# EasyEDA Pro project cnc_machine.eprj

# Schematic Schematic1
Board Name: Board1; Create Date: 2026-08-07; Page Name: P1; Project Name: cnc_machine; Schematic Name: Schematic1; Update Date: 2026-08-10; Company: EasyEDA.com; Page Size: A4; Version: V1.0
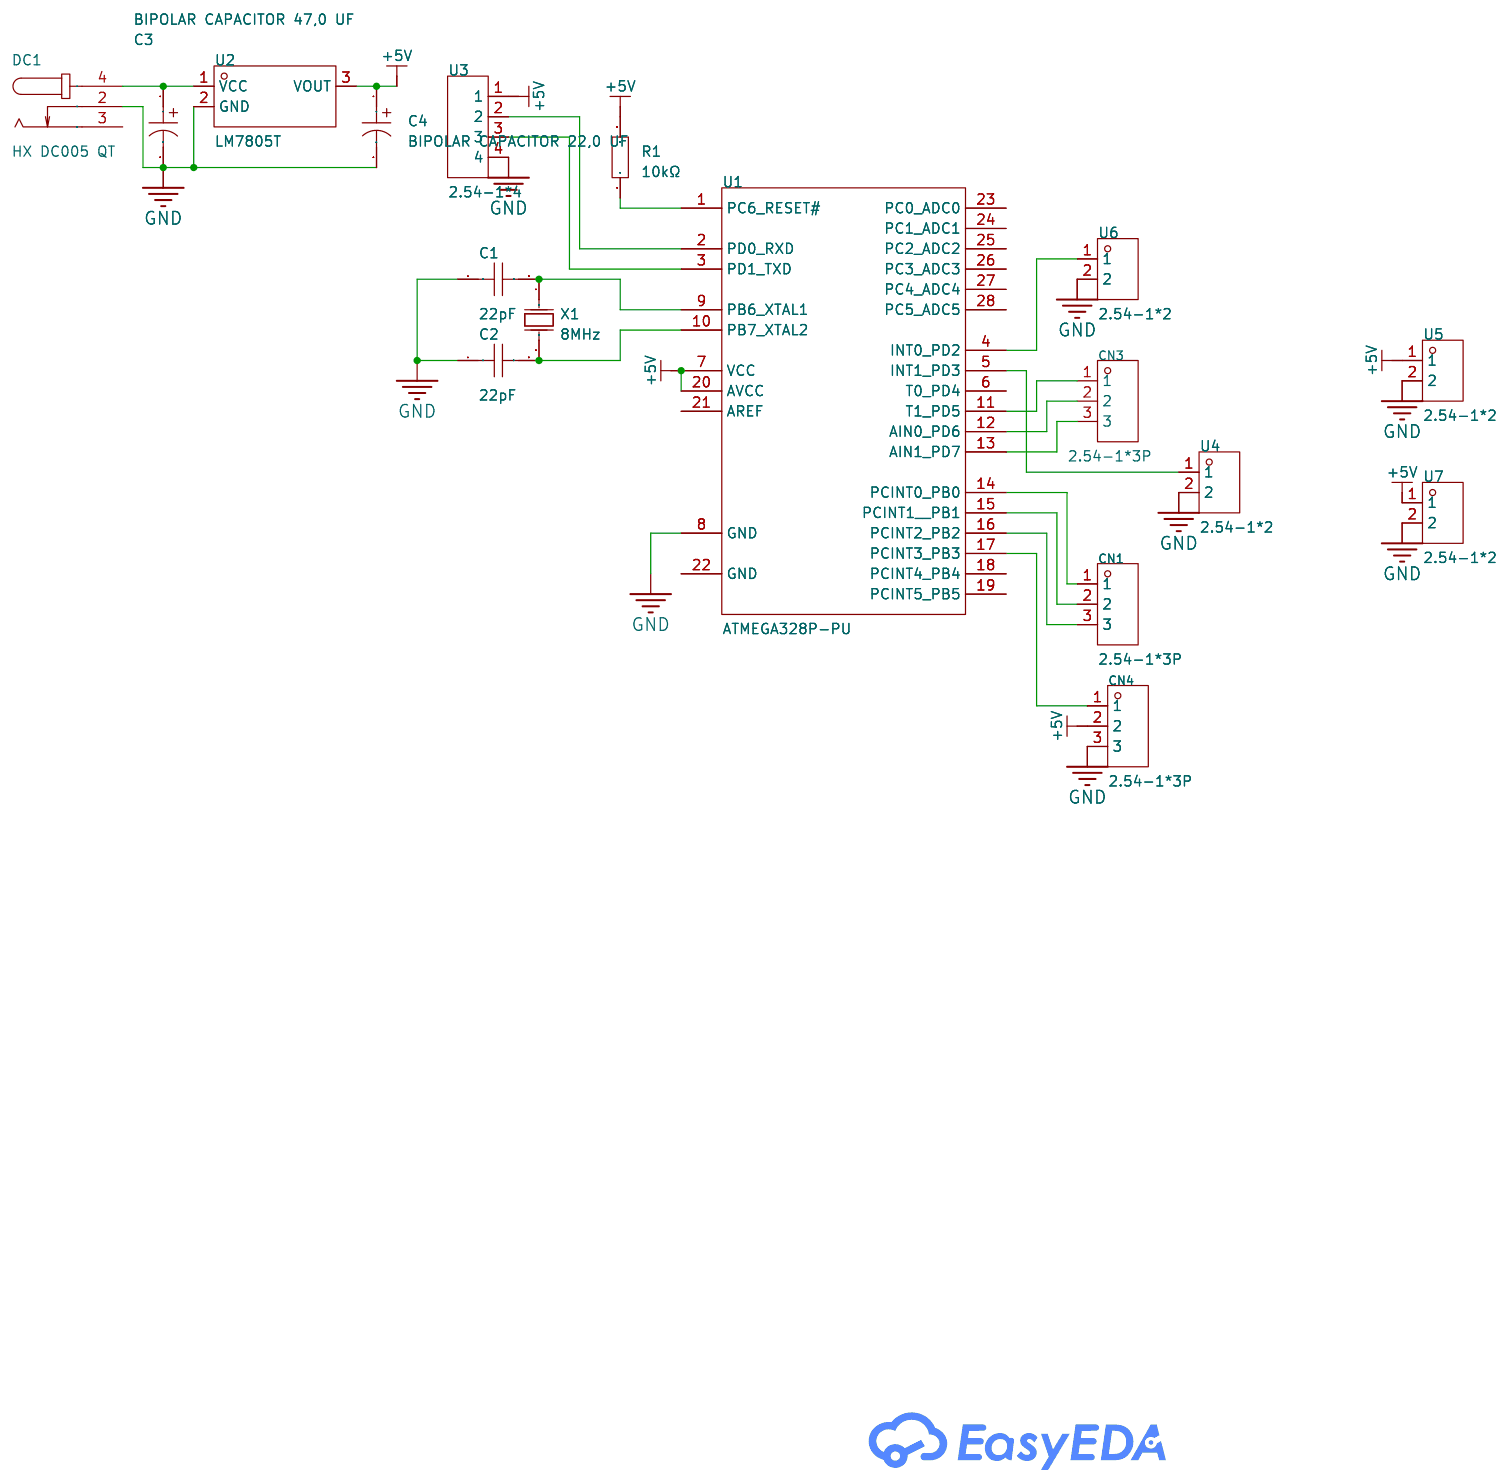
[diagram p0: schematic sheet]

## Parts
C1  22pF  [CAP-TH_L5.8-W2.4-P2.54-D0.6]
C2  22pF  [CAP-TH_L5.8-W2.4-P2.54-D0.6]
C3  BIPOLAR CAPACITOR 47,0 UF  [CAP-TH_BD13.0-P5.00-D0.6-FD]
C4  BIPOLAR CAPACITOR 22,0 UF  [CAP-TH_BD10.0-P5.00-D0.6-FD]
CN1  2.54-1*3P  [CONN-TH_C722693]
CN3  2.54-1*3P  [CONN-TH_C722693]
CN4  2.54-1*3P  [CONN-TH_C722693]
DC1  HX DC005 QT  [DC-IN-TH_HANXIA_HX-DC005-QT]
R1  10kΩ  [RES-TH_BD2.7-L6.2-P10.20-D0.4]
U1  ATMEGA328P-PU  [DIP-28_L34.6-W7.3-P2.54-LS10.2-BL]
U2  LM7805T  [TO-220-3_L10.1-W4.7-P2.54-L]
U3  2.54-1*4  [HDR-TH_4P-P2.54-V-M-1]
U4  2.54-1*2  [HDR-TH_2P-P2.54-V-M]
U5  2.54-1*2  [HDR-TH_2P-P2.54-V-M]
U6  2.54-1*2  [HDR-TH_2P-P2.54-V-M]
U7  2.54-1*2  [HDR-TH_2P-P2.54-V-M]
X1  8MHz  [OSC-TH_L10.0-W4.5-P5.00]

## Library data of the parts
C1 C2 = CC1H220KA1EDCH4B1100: Capacitance:22pF Tolerance:±10% Tolerance:±10% Voltage Rating:50V Pin Spacing:2.54mm Temperature Coefficient:NP0 Diameter:4.8mm Body Thickness:2.4mm; LCSC Part Name: 22pF ±10% 50V; Supplier Part: C2832510; Manufacturer: Dersonic(德尔创); Supplier Footprint: 插件,P=2.54mm; JLCPCB Part Class: Extended Part; Datasheet: https://item.szlcsc.com/datasheet/CC1H220KA1EDCH4B1100/2990648.html; Supplier: LCSC; Tolerance: ±10%; Voltage Rating: 50V; Pin Spacing: 2.54mm; Temperature Coefficient: NP0; Diameter: 4.8mm; Body Thickness: 2.4mm
C3 = BIPOLAR CAPACITOR 47,0 UF: Supplier Part: C6868972; Manufacturer: Visaton; Supplier Footprint: 插件,D13xL26mm; JLCPCB Part Class: Extended Part; Supplier: LCSC
C4 = BIPOLAR CAPACITOR 22,0 UF: Supplier Part: C6131732; Manufacturer: Visaton; Supplier Footprint: 插件,D10xL25.5mm; JLCPCB Part Class: Extended Part; Supplier: LCSC
CN1 CN3 CN4 = 2.54-1*3P: Pins Structure:1x3P Pitch:2.5mm Mounting Type:Through Hole Reference Series:- Number of Pins:3P Number of Rows:1 Number of PINs Per Row:3 Row Spacing:- Current Rating:2A Contact Material:Brass Operating Temperature:-25℃~+85℃ Operating Temperature:-25℃~+85; LCSC Part Name: 1x3P 间距:2.5mm 直插; Supplier Part: C722693; Manufacturer: CAX(创都); Supplier Footprint: 插件,P=2.5mm; JLCPCB Part Class: Extended Part; Datasheet: https://item.szlcsc.com/datasheet/2.54-1*3P/766900.html; Supplier: LCSC; Pins Structure: 1x3P; Pitch: 2.5mm; Mounting Type: Through Hole; Number of Pins: 3P; Number of Rows: 1; Number of PINs Per Row: 3; Current Rating: 2A; Contact Material: Brass; Operating Temperature: -25℃~+85℃; Voltage Rating: 250V; Plastic Material: PA66; Z-Height of the Board: 7mm; X-Length of Bottom Edge on Board (Spacing Line): 7.5mm; Y-Width of Bottom Edge on Board: 5.8mm
DC1 = HX DC005 QT: Connector Type:DC Power Jack Mounting Type:Right Angle Inside Contact Diameter:2mm Outside Contact Diameter:6.3mm Current Rating:2A Voltage Rating (Max):30V Operating Temperature:-25℃~+70℃ Operating Temperature:-25℃~+70℃; LCSC Part Name: DC电源插座 内径:2mm 外径:6.3mm; Supplier Part: C5184829; Manufacturer: hanxia(韩下); Supplier Footprint: 插件; JLCPCB Part Class: Extended Part; Datasheet: https://item.szlcsc.com/datasheet/HX%2520DC005%2520QT/5851208.html; Supplier: LCSC; Connector Type: DC Power Jack; Mounting Type: Right Angle; Inside Contact Diameter: 2mm; Outside Contact Diameter: 6.3mm; Current Rating: 2A; Voltage Rating (Max): 30V; Operating Temperature: -25℃~+70℃
R1 = MF1/4W-10K±1%-ST52: Type:Metal Film Resistor Resistance:10kΩ Tolerance:±1% Tolerance:±1% Voltage-Supply(Max):250V Power(Watts):250mW Temperature Coefficient:±100ppm/℃ Temperature Coefficient:±100ppm/℃ Operating Temperature:-55℃~+155℃ Operating Temperature:-55℃~+155℃; LCSC Part Name: 金属膜电阻 10kΩ ±1% 250mW; Supplier Part: C2903232; Manufacturer: VO(翔胜); Supplier Footprint: 插件,D2.7xL6.2mm; JLCPCB Part Class: Extended Part; Datasheet: https://item.szlcsc.com/datasheet/MF1%252F4W-10K%25C2%25B11%2525-ST52/3158983.html; Supplier: LCSC; Type: Metal Film Resistor; Tolerance: ±1%; Voltage-Supply(Max): 250V; Power(Watts): 250mW; Temperature Coefficient: ±100ppm/℃; Operating Temperature: -55℃~+155℃
U1 = ATMEGA328P-PU: CPU Core:AVR CPU Maximum Speed:20MHz Program Storage Size:32KB Program Memory Type:FLASH Number of I/O:23 ADC (Bit):10bit Voltage - Supply:1.8V~5.5V Voltage - Supply:1.8V~5.5V Applications:-; LCSC Part Name: MSL=1 基于AVR增强型RISC架构的低功耗CMOS 8位微控制器; Supplier Part: C33901; Manufacturer: MICROCHIP(美国微芯); Supplier Footprint: DIP-28-300mil; JLCPCB Part Class: Extended Part; Datasheet: https://item.szlcsc.com/datasheet/ATMEGA328P-PU/34869.html; Supplier: LCSC; CPU Core: AVR; CPU Maximum Speed: 20MHz; Program Storage Size: 32KB; Program Memory Type: FLASH; Number of I/O: 23; ADC (Bit): 10bit; Voltage - Supply: 1.8V~5.5V
U2 = LM7805T_C7432180: Output Configuration:Positive Voltage - Supply:35V Output Voltage:5V Output Voltage:5V Output Current:1.2A Power Supply Rejection Ratio (PSRR):62dB@(120Hz) Voltage Dropout:- standby current:- Noise:40uV Features:Short Circuit Protection；Thermal shutdown O; LCSC Part Name: 5V 1.2A 35V; Supplier Part: C7432180; Manufacturer: HGSEMI(华冠); Supplier Footprint: TO-220-3; JLCPCB Part Class: Extended Part; Datasheet: https://item.szlcsc.com/datasheet/LM7805T/8436622.html; Supplier: LCSC; Output Configuration: Positive; Voltage - Supply: 35V; Output Voltage: 5V; Output Current: 1.2A; Power Supply Rejection Ratio (PSRR): 62dB@(120Hz); Noise: 40uV; Features: Short Circuit Protection；Thermal shutdown; Operating Temperature: 0℃~+125℃@(Ta); Output Type: Fixed; Number of Outputs: 1
U3 = 2.54-1*4: Pin Structure:1x4P Pitch:2.54mm Circluar Pins/Square Pins:Pin Header Mounting Type:Through Hole Number of Rows:1 Number of Pins:4P Current Rating:2.5A Length of Mating Pin:6mm Insulation Height:2.54mm Length of End Connection Pin:3mm Contact Material:Bras; LCSC Part Name: 1x4P 间距:2.54mm 方针 直插; Supplier Part: C5116483; Manufacturer: ZHOURI(洲日); Supplier Footprint: 插件,P=2.54mm; JLCPCB Part Class: Extended Part; Datasheet: https://item.szlcsc.com/datasheet/2.54-1*4/5692726.html; Supplier: LCSC; Pin Structure: 1x4P; Pitch: 2.54mm; Circluar Pins/Square Pins: Pin Header; Mounting Type: Through Hole; Number of Rows: 1; Number of Pins: 4P; Current Rating: 2.5A; Length of Mating Pin: 6mm; Insulation Height: 2.54mm; Length of End Connection Pin: 3mm; Contact Material: Brass; Contact Plating: Gold; Operating Temperature: -40℃~+105℃
U4-U7 = 2.54-1*2: Pin Structure:1x2P Pitch:2.54mm Circluar Pins/Square Pins:Pin Header Mounting Type:Through Hole Number of Rows:1 Number of Pins:2P Current Rating:2.5A Length of Mating Pin:6mm Insulation Height:2.54mm Length of End Connection Pin:3mm Contact Material:Bras; LCSC Part Name: 停产 1x2P 间距:2.54mm 方针 直插; Supplier Part: C5116481; Manufacturer: ZHOURI(洲日); Supplier Footprint: 插件,P=2.54mm; JLCPCB Part Class: Extended Part; Datasheet: https://item.szlcsc.com/datasheet/2.54-1*2/5692724.html; Supplier: LCSC; Pin Structure: 1x2P; Pitch: 2.54mm; Circluar Pins/Square Pins: Pin Header; Mounting Type: Through Hole; Number of Rows: 1; Number of Pins: 2P; Current Rating: 2.5A; Length of Mating Pin: 6mm; Insulation Height: 2.54mm; Length of End Connection Pin: 3mm; Contact Material: Brass; Contact Plating: Gold; Operating Temperature: -40℃~+105℃
X1 = X49SD8MSD2SC: Type:Through Hole Crystal Oscillator Frequency:8MHz Normal temperature Frequency Tolerance:±20ppm Normal temperature Frequency Tolerance:±20ppm Load Capacitance:20pF Frequency Stability:±30ppm Frequency Stability:±30ppm Operating Temperature:-20℃~+70℃ Ope; LCSC Part Name: HC-49US 8MHZ 20PF ±20PPM -20~70℃ (±30PPM); Supplier Part: C21263; Manufacturer: YXC(扬兴晶振); Supplier Footprint: HC-49S; JLCPCB Part Class: Extended Part; Datasheet: https://item.szlcsc.com/datasheet/X49SD8MSD2SC/21980.html; Supplier: LCSC; Type: Through Hole Crystal Oscillator; Normal temperature Frequency Tolerance: ±20ppm; Load Capacitance: 20pF; Frequency Stability: ±30ppm; Operating Temperature: -20℃~+70℃

## Nets
+5V: C4.1 CN4.2 R1.2 U1.7(VCC) U1.20(AVCC) U2.3(VOUT) U3.1 U5.1 U7.1
GND: C1.1 C2.1 C3.2 C4.2 CN4.3 DC1.2 U1.8(GND) U2.2(GND) U3.4 U4.2 U5.2 U6.2 U7.2
$1N785: CN3.1 U1.11(T1 PD5)
$1N787: CN3.2 U1.12(AIN0 PD6)
$1N789: CN3.3 U1.13(AIN1 PD7)
$1N1204: C1.2 U1.9(PB6 XTAL1) X1.1(OSC1)
$1N1213: C2.2 U1.10(PB7 XTAL2) X1.2(OSC2)
$1N1271: R1.1 U1.1(PC6 RESET#)
$1N1369: U1.2(PD0 RXD) U3.2
$1N1378: U1.3(PD1 TXD) U3.3
$1N1468: CN1.1 U1.14(PCINT0 PB0)
$1N1472: CN1.2 U1.15(PCINT1  PB1)
$1N1477: CN1.3 U1.16(PCINT2 PB2)
$1N1538: CN4.1 U1.17(PCINT3 PB3)
$1N1853: U1.4(INT0 PD2) U6.1
$1N1890: U1.5(INT1 PD3) U4.1
$1N2028: C3.1 DC1.4 U2.1(VCC)

Not connected (* = marked no-connect by the designer): DC1 3; U1 6(T0 PD4) 18(PCINT4 PB4) 19(PCINT5 PB5) 21(AREF) 22(GND) 23(PC0 ADC0) 24(PC1 ADC1) 25(PC2 ADC2) 26(PC3 ADC3) 27(PC4 ADC4) 28(PC5 ADC5)

# Board PCB4
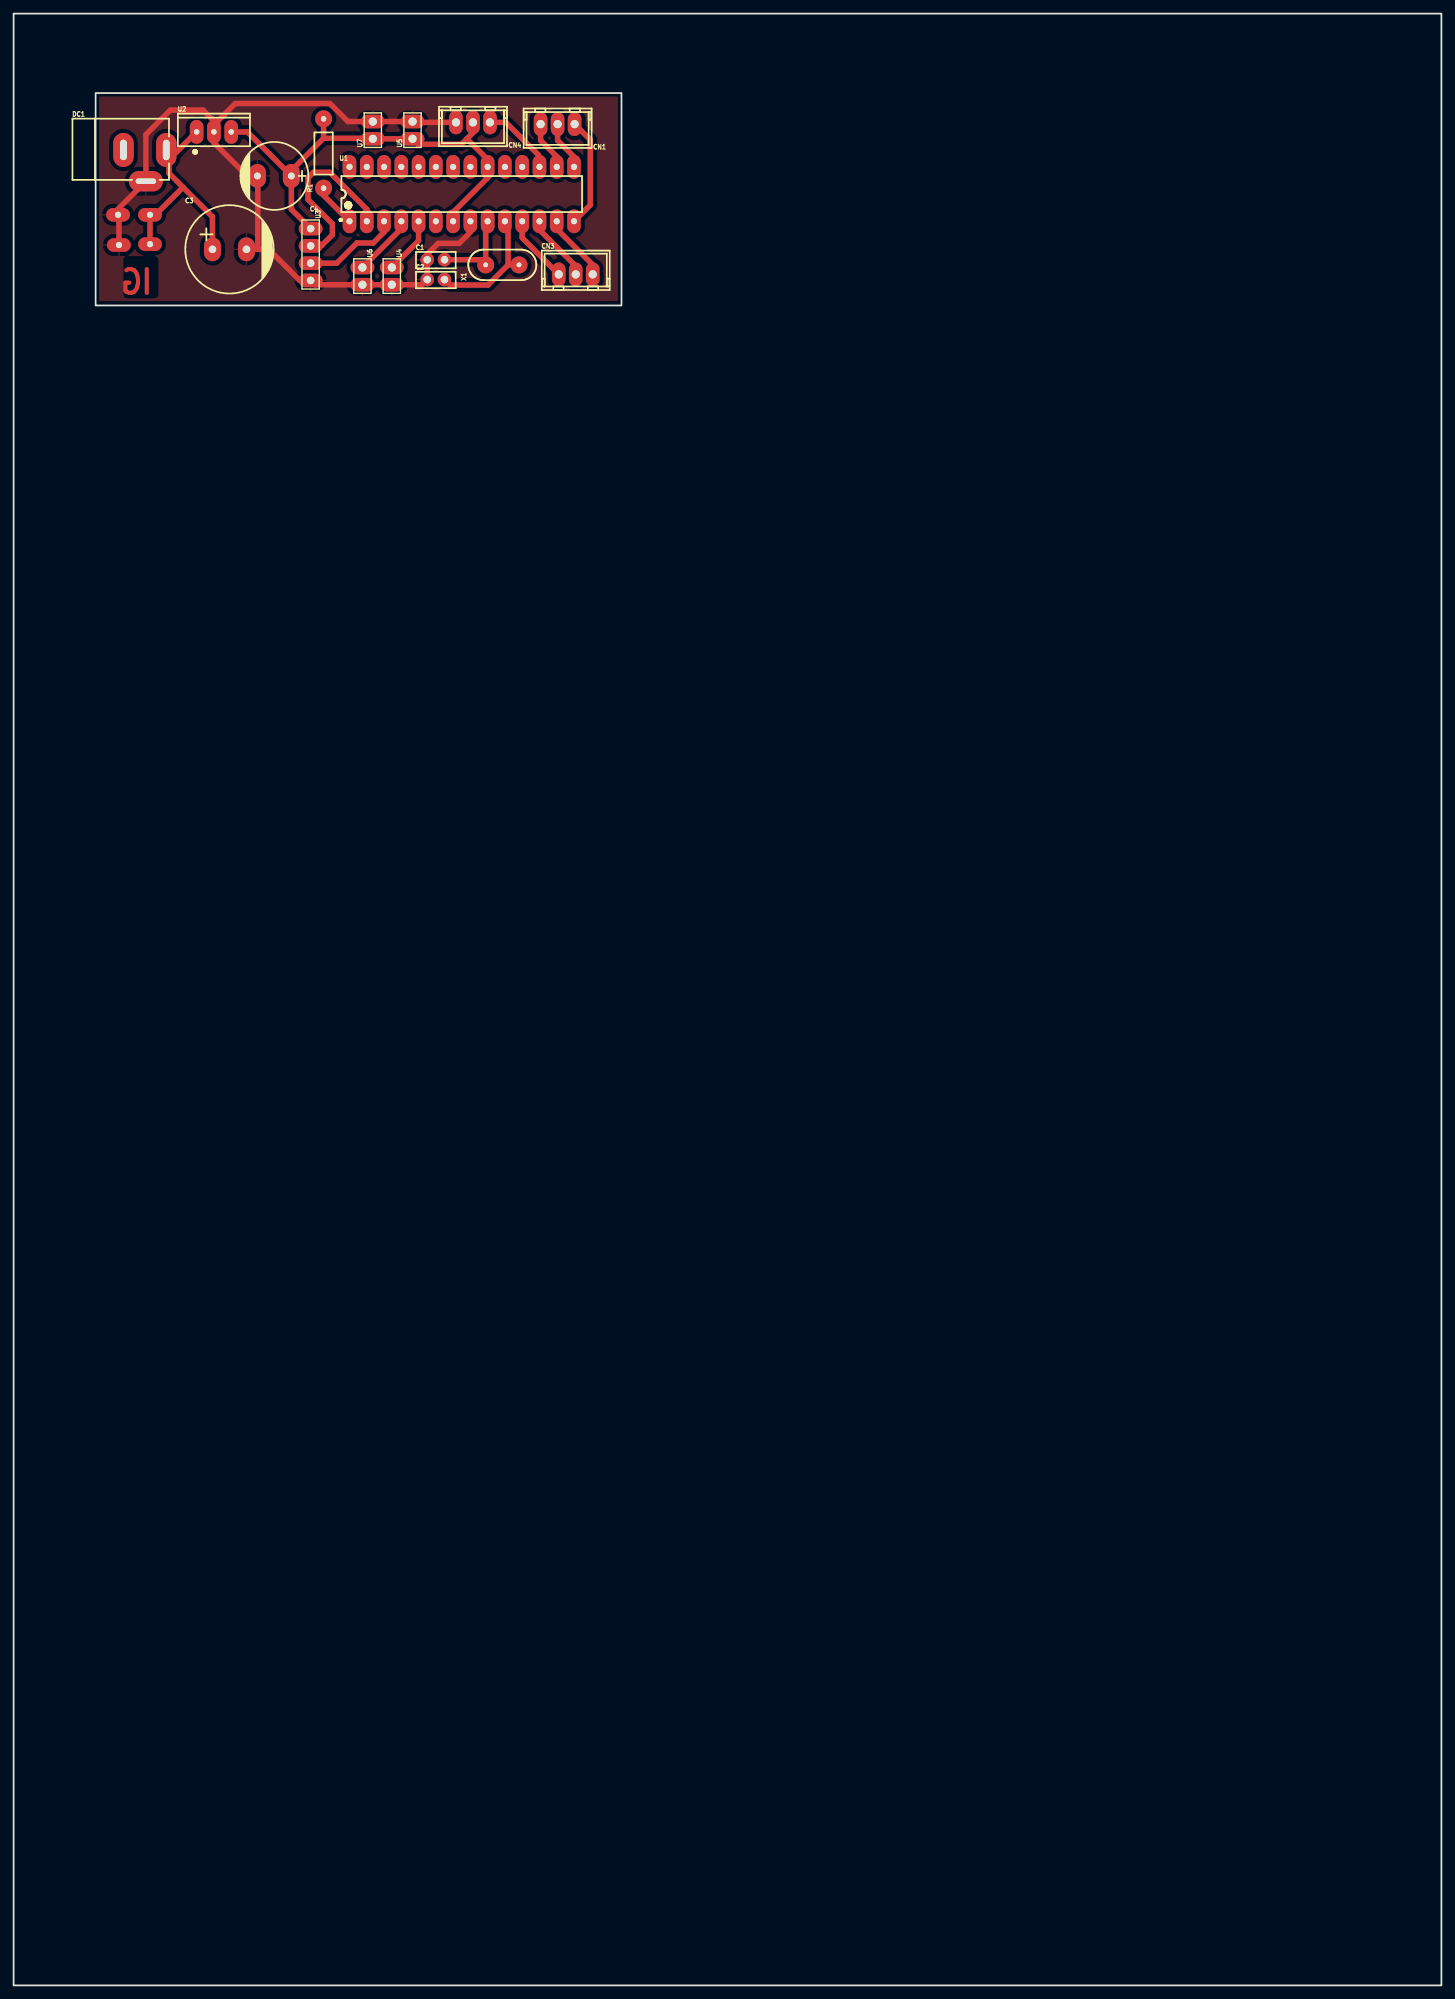
[diagram p1: board, top side]
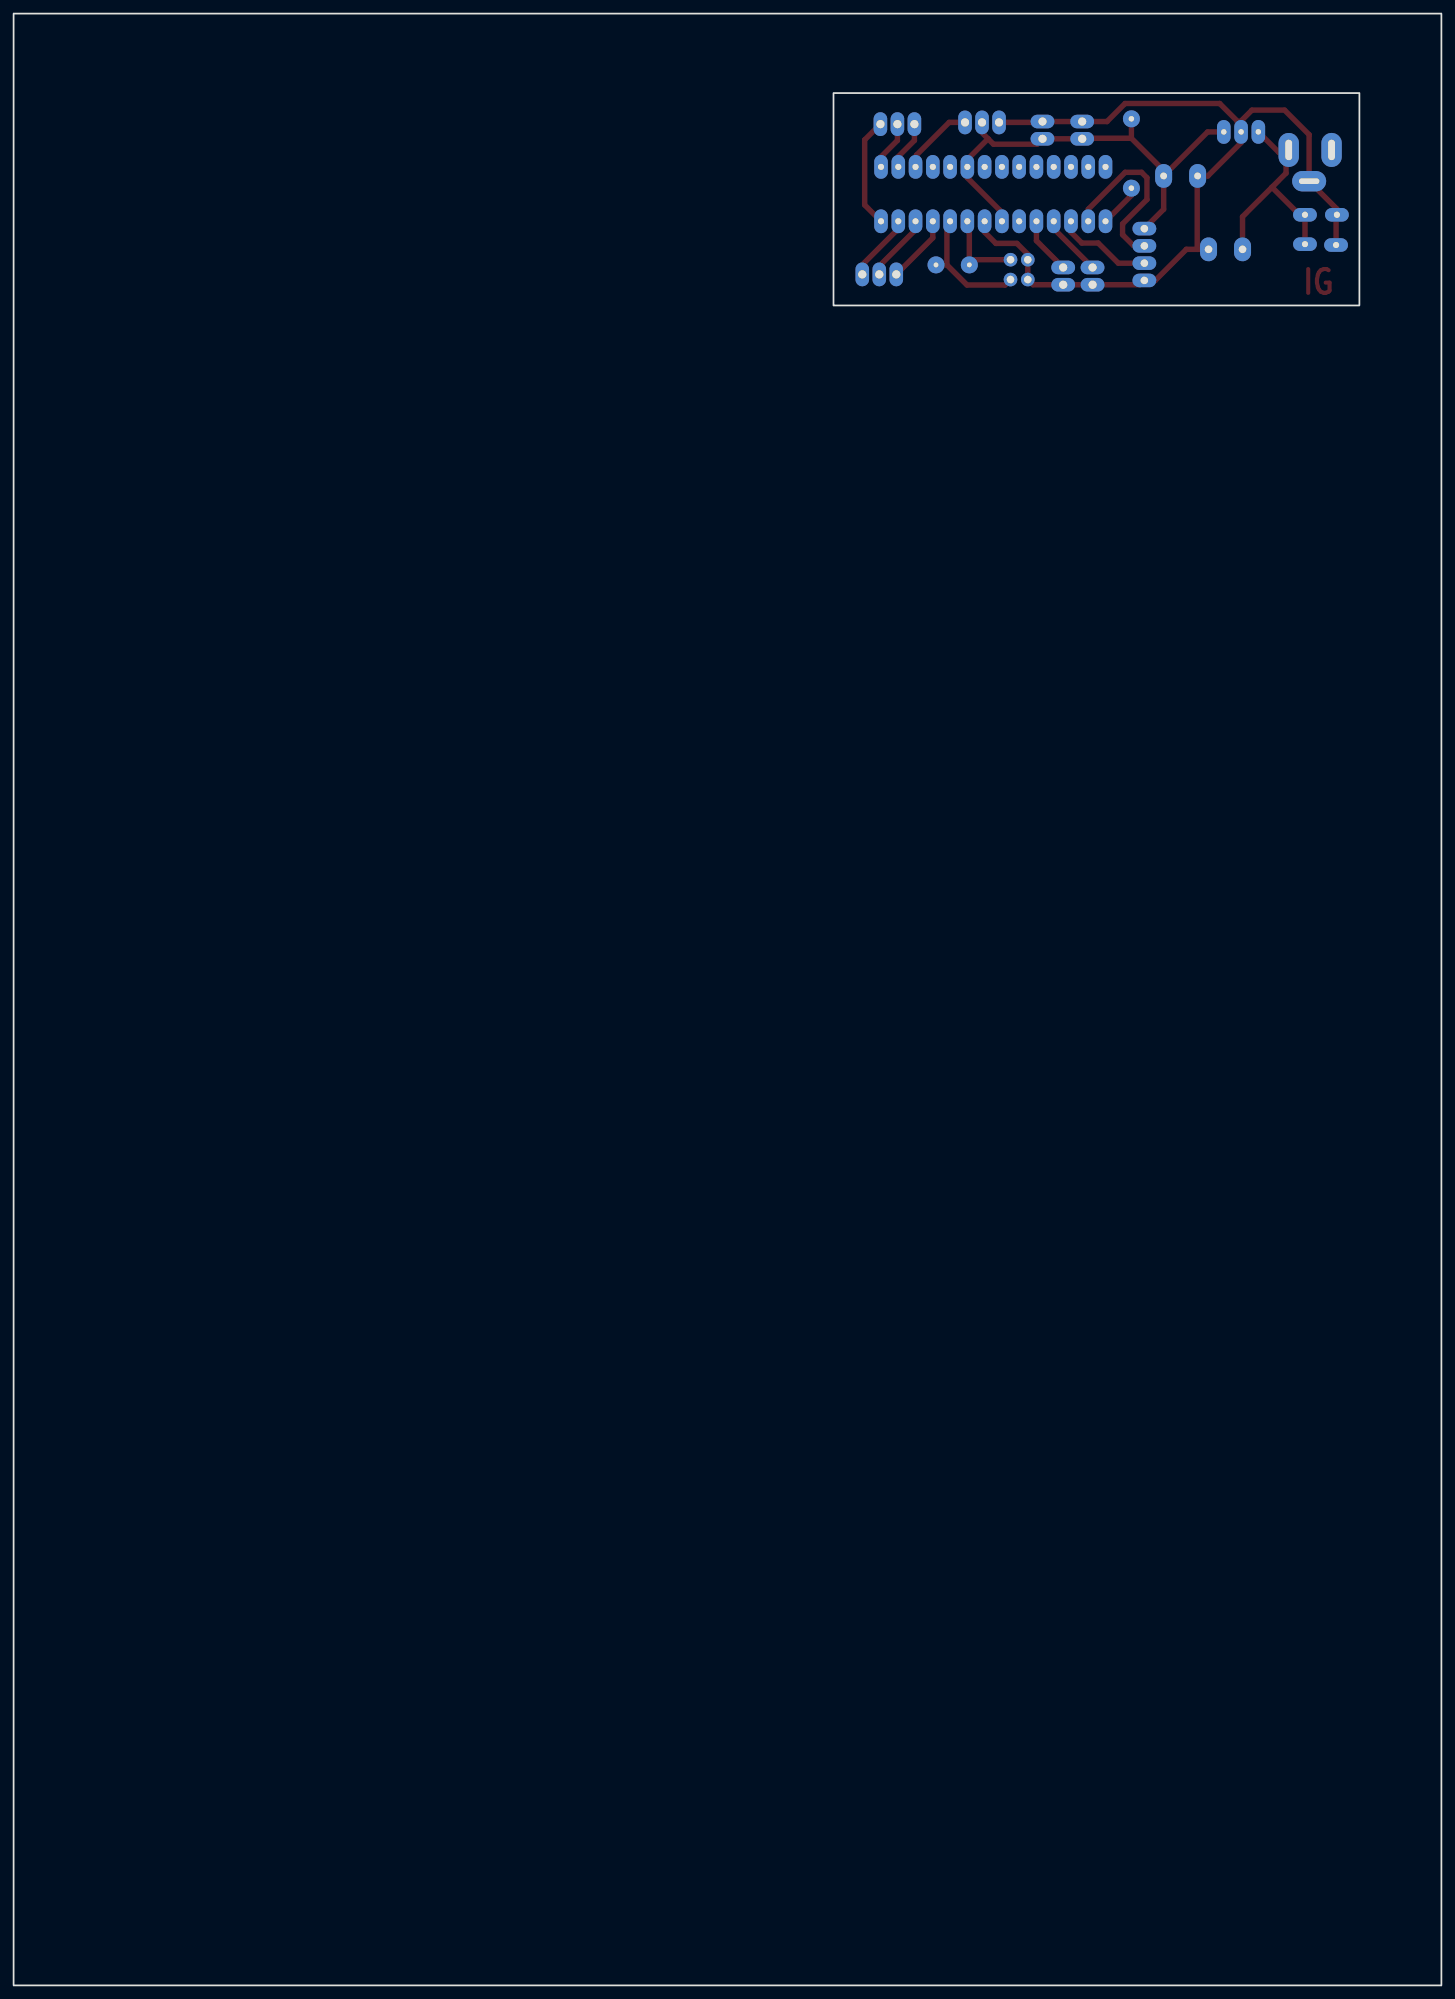
[diagram p2: board, bottom side, seen from below]

Outline 210 x 290 mm; copper layers: Top Layer, Bottom Layer. Coordinates in mm from the lower left corner of the outline.
Outline path: rectangle 0,290 210,0 ; rectangle 12.06,278.32 89.41,247.07
Stack: Top Layer 0.035mm / Dielectric1 1.51mm FR4 er 4.5 / Bottom Layer 0.035mm

## Design rules (mm)
template: Custom Config
spacing copperThickness1oz (default): track to track 0.6, other pairs 0.152 to 0.6
spacing copperThickness2oz: track to track 0.203, other pairs 0.152 to 0.3
track width copperThickness1oz (default): min 0.7, default 0.8, max 0.9
track width copperThickness2oz: min 0.203, default 0.254, max 2.54
differential pair differentialPair (default): width min 0.127, default 0.254, max 2.54; gap min 0.152, default 0.152
via viaSize (default): diameter min 0.5, default 0.61, max 10; hole min 0.3, default 0.305, max 6.3

## Placement (name value [footprint] x y rotation side)
C1  22pF  [CAP-TH_L5.8-W2.4-P2.54-D0.6]  62.1 253.81 0 top
C2  22pF  [CAP-TH_L5.8-W2.4-P2.54-D0.6]  62.1 250.88 0 top
C3  BIPOLAR CAPACITOR 47,0 UF  [CAP-TH_BD13.0-P5.00-D0.6-FD]  31.75 255.33 0 top
C4  BIPOLAR CAPACITOR 22,0 UF  [CAP-TH_BD10.0-P5.00-D0.6-FD]  38.35 266.12 180 top
CN1  2.54-1*3P  [CONN-TH_C722693]  80.01 273.74 180 top
CN3  2.54-1*3P  [CONN-TH_C722693]  82.68 251.65 0 top
CN4  2.54-1*3P  [CONN-TH_C722693]  67.56 274 180 top
DC1  HX DC005 QT  [DC-IN-TH_HANXIA_HX-DC005-QT]  19.3 267.65 0 top
NOREF  -  [Pad_e16537]  20.07 256.09 270 top
NOREF#2  -  [Pad_e16535]  15.37 260.41 270 top
NOREF#3  -  [Pad_e16530]  20.07 260.41 270 top
NOREF#4  -  [Pad_e16536]  15.49 255.96 270 top
R1  10kΩ  [RES-TH_BD2.7-L6.2-P10.20-D0.4]  45.59 269.43 90 top
U1  ATMEGA328P-PU  [DIP-28_L34.6-W7.3-P2.54-LS10.2-BL]  65.91 263.46 0 top
U2  LM7805T  [TO-220-3_L10.1-W4.7-P2.54-L]  29.46 272.6 0 top
U3  2.54-1*4  [HDR-TH_4P-P2.54-V-M-1]  43.69 254.57 270 top
U4  2.54-1*2  [HDR-TH_2P-P2.54-V-M]  55.63 251.39 270 top
U5  2.54-1*2  [HDR-TH_2P-P2.54-V-M]  58.67 272.86 90 top
U6  2.54-1*2  [HDR-TH_2P-P2.54-V-M]  51.31 251.39 270 top
U7  2.54-1*2  [HDR-TH_2P-P2.54-V-M]  52.83 272.86 90 top
X1  8MHz  [OSC-TH_L10.0-W4.5-P5.00]  71.88 253.04 90 top

## Footprints (pads in the part's own frame, mm; a bottom-side part is the same pattern mirrored in y, then rotated)
CAP-TH_BD10.0-P5.00-D0.6-FD
  oval 2.5x3.5 hole 1: 1(-2.5,0) 2(2.5,0)
CAP-TH_BD13.0-P5.00-D0.6-FD
  oval 2.5x3.5 hole 1.1: 1(-2.5,0) 2(2.5,0)
CAP-TH_L5.8-W2.4-P2.54-D0.6
  round 2 hole 1.1x0.6: 1(-1.27,0) 2(1.27,0)
CONN-TH_C722693
  oval 2x3.5 hole 1.2x0.9: 1(-2.5,0) 2(0,0) 3(2.5,0)
DC-IN-TH_HANXIA_HX-DC005-QT
  oval 5x3 hole 3x0.8: 2(0.15,-2.3)
  oval 3x5 hole 1x3: 3(-3.15,2.3) 4(3.15,2.3)
DIP-28_L34.6-W7.3-P2.54-LS10.2-BL
  oval 2x3.5 hole 0.9: 1(-16.51,-4) 2(-13.97,-4) 3(-11.43,-4) 4(-8.89,-4) 5(-6.35,-4) 6(-3.81,-4) 7(-1.27,-4) 8(1.27,-4) 9(3.81,-4) 10(6.35,-4) 11(8.89,-4) 12(11.43,-4) 13(13.97,-4) 15(16.51,4) 16(13.97,4) 17(11.43,4) 18(8.89,4) 19(6.35,4) 20(3.81,4) 21(1.27,4) 22(-1.27,4) 23(-3.81,4) 24(-6.35,4) 25(-8.89,4) 26(-11.43,4) 27(-13.97,4) 28(-16.51,4)
  oval 2x3.5 hole 0.9x0.8: 14(16.51,-4)
HDR-TH_2P-P2.54-V-M
  oval 2x3.5 hole 1.2x0.9: 1(-1.27,0) 2(1.27,0)
HDR-TH_4P-P2.54-V-M-1
  oval 2x3.5 hole 1.1x0.9: 1(-3.81,0) 2(-1.27,0) 3(1.27,0) 4(3.81,0)
OSC-TH_L10.0-W4.5-P5.00
  round 2.5 hole 0.7: 1(0,2.45) 2(0,-2.45)
Pad_e16530
  oval 2x3.5 hole 0.9: 1(0,0)
Pad_e16535
  oval 2x3.5 hole 0.9: 1(0,0)
Pad_e16536
  oval 2x3.5 hole 0.9: 1(0,0)
Pad_e16537
  oval 2x3.5 hole 0.9: 1(0,0)
RES-TH_BD2.7-L6.2-P10.20-D0.4
  round 2.5 hole 0.8: 1(-5.1,0) 2(5.1,0)
TO-220-3_L10.1-W4.7-P2.54-L
  oval 2x3.5 hole 0.8x1.2: 1(-2.54,0.005) 2(0,0.005) 3(2.54,-0.005)

## Nets
As in the schematic, except:
GND: C1.1 C2.1 C3.2 C4.2 CN4.3 DC1.2 NOREF#2.1 NOREF#4.1 U1.8 U2.2 U3.4 U4.2 U5.2 U6.2 U7.2
$1N2028: C3.1 DC1.4 NOREF.1 NOREF#3.1 U2.1

Pads without a net: DC1 3; U1 6 18 19 21 22 23 24 25 26 27 28

## Routing (per net, layer and track width the routed paths; a pad name or vN(x,y) marks a point on that pad's centre or on a via; arc(x,y) is an arc through that point)
+5V: length 70.9
  Top Layer w0.8: 45.59,271.66 45.59,274.53 ; 45.59,271.66 40.85,266.92 C4.1 ; 45.59,271.66 52.75,271.66 U7.1 U5.1 59.47,270.79 65.87,270.79 66.67,271.58 ; 66.67,271.58 67.56,272.48 CN4.2 ; 66.67,271.58 69.72,268.54 U1.20 69.72,265.86 64.92,261.06 64.92,259.74 U1.7 ; C4.1 34.38,272.6 32,272.6 ; C4.1 40.85,261.21 U3.1
GND: length 133.7
  Top Layer w0.8: 35.92,255.33 35.92,266.06 C4.2 34.35,266.12 29.45,271.02 U2.2 ; 35.92,255.33 C3.2 ; 35.92,255.33 37.52,255.33 42.09,250.76 U3.4 44.32,250.12 U6.2 U4.2 60.07,250.12 C2.1 C1.1 60.83,254.61 62.43,256.2 65.53,256.2 67.13,257.81 67.13,259.41 U1.8 ; U2.2 29.46,274.21 27.86,275.81 23.06,275.81 19.45,272.2 DC1.2 15.37,261.26 NOREF#2.1 15.49,260.28 NOREF#4.1 ; U2.2 30,273.15 30,274.17 32.61,276.78 46.52,276.78 49.18,274.12 U7.2 U5.2 58.8,274 CN4.3
$1N785: length 10
  Top Layer w0.8: U1.11 74.8,257.02 CN3.1
$1N787: length 10
  Top Layer w0.8: CN3.2 82.68,252.87 77.34,258.2 U1.12
$1N789: length 10
  Top Layer w0.8: U1.13 79.88,258.35 85.18,253.06 CN3.3
$1N1204: length 12.9
  Top Layer w0.8: U1.9 69.43,259.17 X1.1 68.67,253.81 C1.2
$1N1213: length 19.1
  Top Layer w0.8: 72.73,253.04 X1.2 ; 72.73,253.04 72.73,258.99 U1.10 ; 72.73,253.04 69.77,250.08 64.17,250.08 C2.2
$1N1271: length 6.4
  Top Layer w0.8: U1.1 45.59,263.27 R1.1
$1N1369: length 26.7
  Top Layer w0.8: U3.2 43.73,255.88 45.29,255.88 46.89,257.48 46.89,259.08 43.31,262.66 43.31,265.86 44.11,266.66 46.51,266.66 51.94,261.22 U1.2
$1N1378: length 14.3
  Top Layer w0.8: U1.3 54.48,257.86 52.88,256.26 50.48,256.26 47.52,253.3 U3.3
$1N1468: length 16.2
  Top Layer w0.8: CN1.1 84.82,271.43 84.82,261.86 U1.14
$1N1472: length 7.3
  Top Layer w0.8: CN1.2 80.01,271.34 82.41,268.94 82.41,267.47 U1.15
$1N1477: length 7.3
  Top Layer w0.8: CN1.3 77.51,271.34 79.91,268.94 79.91,267.48 U1.16
$1N1538: length 10.9
  Top Layer w0.8: U1.17 77.2,267.6 77.2,269.2 72.4,274 CN4.1
$1N1853: length 9.2
  Top Layer w0.8: U6.1 57.02,258.38 U1.4
$1N1890: length 8.4
  Top Layer w0.8: U1.5 59.56,256.6 U4.1
$1N2028: length 33.6
  Top Layer w0.8: NOREF.1 NOREF#3.1 20.86,260.41 24.92,264.46 ; 22.85,269.55 23.87,269.55 26.92,272.61 ; 22.85,269.55 22.85,266.53 24.92,264.46 ; 22.85,269.55 DC1.4 ; C3.1 29.25,260.13 24.92,264.46

## Copper pours and planes (outline as drawn; the poured copper is in the pictures)
GND on Top Layer: 12.57,277.81 88.9,277.81 88.9,247.71 12.57,247.71

## Text on the board
Top Layer: IG
